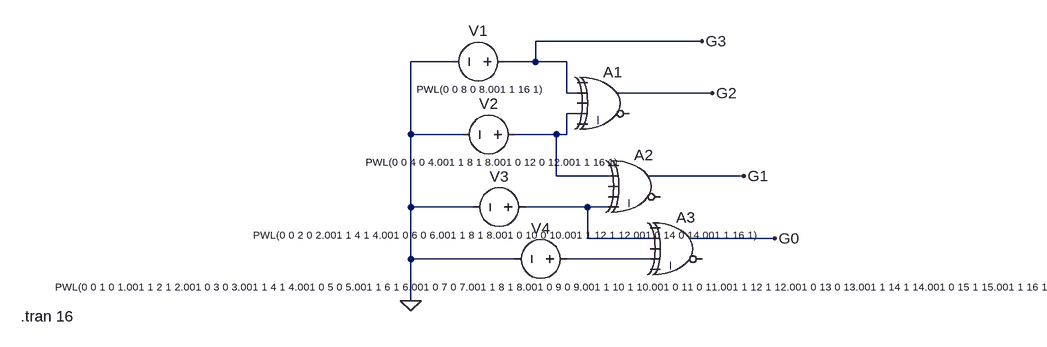
[diagram p0: schematic binarytogray.asc]
binarytogray.asc, the LTspice schematic file:
Version 4.1
SHEET 1 1212 680
WIRE 256 -32 0 -32
WIRE -128 0 -192 0
WIRE 0 0 0 -32
WIRE 0 0 -48 0
WIRE 48 0 0 0
WIRE 48 48 48 0
WIRE 64 48 48 48
WIRE 272 48 128 48
WIRE 64 80 48 80
WIRE -192 112 -192 0
WIRE -112 112 -192 112
WIRE 32 112 -32 112
WIRE 48 112 48 80
WIRE 48 112 32 112
WIRE 32 176 32 112
WIRE 112 176 32 176
WIRE 320 176 176 176
WIRE -192 224 -192 112
WIRE -96 224 -192 224
WIRE 80 224 -16 224
WIRE 112 224 80 224
WIRE 80 272 80 224
WIRE 176 272 80 272
WIRE 368 272 240 272
WIRE -192 304 -192 224
WIRE -32 304 -192 304
WIRE 176 304 48 304
WIRE -192 368 -192 304
FLAG -192 368 0
FLAG 256 -32 G3
FLAG 272 48 G2
FLAG 320 176 G1
FLAG 368 272 G0
SYMBOL Digital\\xor 112 0 R0
SYMATTR InstName A1
SYMBOL Digital\\xor 160 128 R0
SYMATTR InstName A2
SYMBOL Digital\\xor 224 224 R0
SYMATTR InstName A3
SYMBOL voltage -32 0 R90
WINDOW 0 -32 56 VBottom 2
WINDOW 3 32 56 VTop 1
WINDOW 123 0 0 Left 0
WINDOW 39 0 0 Left 0
SYMATTR InstName V1
SYMATTR Value PWL(0 0 8 0 8.001 1 16 1)
SYMBOL voltage -16 112 R90
WINDOW 0 -32 56 VBottom 2
WINDOW 3 32 56 VTop 1
WINDOW 123 0 0 Left 0
WINDOW 39 0 0 Left 0
SYMATTR InstName V2
SYMATTR Value PWL(0 0 4 0 4.001 1 8 1 8.001 0 12 0 12.001 1 16 1)
SYMBOL voltage 0 224 R90
WINDOW 0 -32 56 VBottom 2
WINDOW 3 32 56 VTop 1
WINDOW 123 0 0 Left 0
WINDOW 39 0 0 Left 0
SYMATTR InstName V3
SYMATTR Value PWL(0 0 2 0 2.001 1 4 1 4.001 0 6 0 6.001 1 8 1 8.001 0 10 0 10.001 1 12 1 12.001 0 14 0 14.001 1 16 1)
SYMBOL voltage 64 304 R90
WINDOW 0 -32 56 VBottom 2
WINDOW 3 32 56 VTop 1
WINDOW 123 0 0 Left 0
WINDOW 39 0 0 Left 0
SYMATTR InstName V4
SYMATTR Value PWL(0 0 1 0 1.001 1 2 1 2.001 0 3 0 3.001 1 4 1 4.001 0 5 0 5.001 1 6 1 6.001 0 7 0 7.001 1 8 1 8.001 0 9 0 9.001 1 10 1 10.001 0 11 0 11.001 1 12 1 12.001 0 13 0 13.001 1 14 1 14.001 0 15 1 15.001 1 16 1)
TEXT -792 392 Left 2 !.tran 16

The netlist it stands for:
* binarytogray.asc
A1 0 G3 0 N001 0 0 G2 0 XOR
A2 0 N001 0 0 N002 0 G1 0 XOR
A3 0 N002 0 N003 0 0 G0 0 XOR
V1 G3 0 PWL(0 0 8 0 8.001 1 16 1)
V2 N001 0 PWL(0 0 4 0 4.001 1 8 1 8.001 0 12 0 12.001 1 16 1)
V3 N002 0 PWL(0 0 2 0 2.001 1 4 1 4.001 0 6 0 6.001 1 8 1 8.001 0 10 0 10.001 1 12 1 12.001 0 14 0 14.001 1 16 1)
V4 N003 0 PWL(0 0 1 0 1.001 1 2 1 2.001 0 3 0 3.001 1 4 1 4.001 0 5 0 5.001 1 6 1 6.001 0 7 0 7.001 1 8 1 8.001 0 9 0 9.001 1 10 1 10.001 0 11 0 11.001 1 12 1 12.001 0 13 0 13.001 1 14 1 14.001 0 15 1 15.001 1 16 1)
.tran 16
.backanno
.end